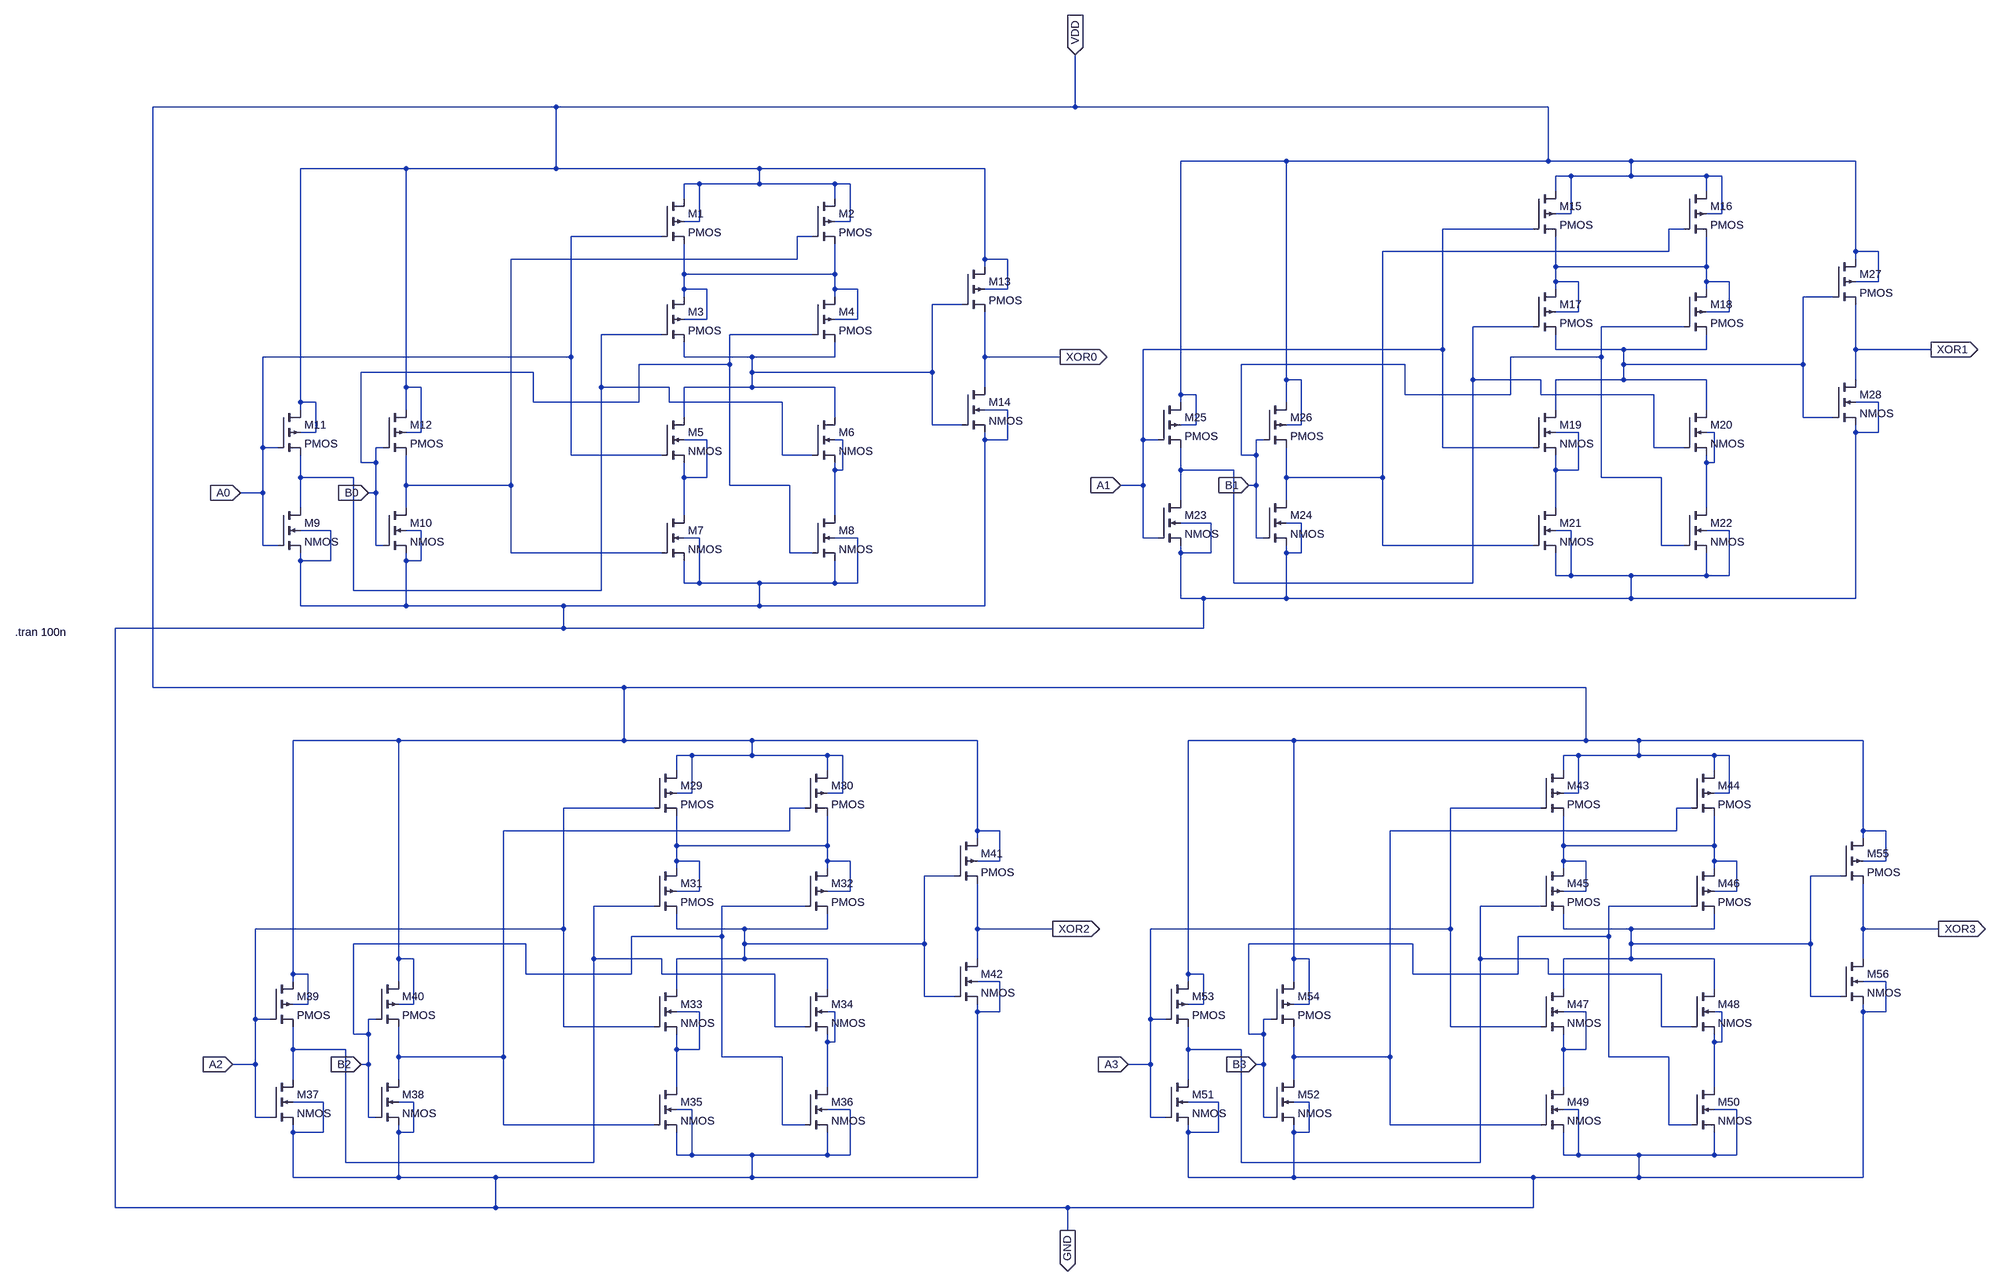
[diagram p0: schematic 4bit_Xor.asc]
4bit_Xor.asc, the LTspice schematic file:
Version 4.1
SHEET 1 3100 2284
WIRE -320 -416 -1424 -416
WIRE 832 -416 832 -624
WIRE 832 -416 -320 -416
WIRE 2096 -416 832 -416
WIRE 1280 -208 1056 -208
WIRE 2096 -208 2096 -416
WIRE 2096 -208 1280 -208
WIRE 2272 -208 2096 -208
WIRE 2800 -208 2272 -208
WIRE -880 -192 -1104 -192
WIRE -320 -192 -320 -416
WIRE -320 -192 -880 -192
WIRE 112 -192 -320 -192
WIRE 640 -192 112 -192
WIRE 2144 -176 2112 -176
WIRE 2272 -176 2272 -208
WIRE 2272 -176 2144 -176
WIRE 2432 -176 2272 -176
WIRE 2464 -176 2432 -176
WIRE -16 -160 -48 -160
WIRE 112 -160 112 -192
WIRE 112 -160 -16 -160
WIRE 272 -160 112 -160
WIRE 304 -160 272 -160
WIRE 2112 -144 2112 -176
WIRE 2432 -144 2432 -176
WIRE -48 -128 -48 -160
WIRE 272 -128 272 -160
WIRE 2144 -96 2144 -176
WIRE 2144 -96 2112 -96
WIRE 2464 -96 2464 -176
WIRE 2464 -96 2432 -96
WIRE -16 -80 -16 -160
WIRE -16 -80 -48 -80
WIRE 304 -80 304 -160
WIRE 304 -80 272 -80
WIRE 2064 -64 1872 -64
WIRE 2384 -64 2352 -64
WIRE -96 -48 -288 -48
WIRE 224 -48 192 -48
WIRE 2352 -16 2352 -64
WIRE 2352 -16 1744 -16
WIRE 2800 -16 2800 -208
WIRE 2848 -16 2800 -16
WIRE 192 0 192 -48
WIRE 192 0 -416 0
WIRE 640 0 640 -192
WIRE 688 0 640 0
WIRE 2800 0 2800 -16
WIRE 640 16 640 0
WIRE 2112 16 2112 -48
WIRE 2432 16 2432 -48
WIRE 2432 16 2112 16
WIRE -48 32 -48 -32
WIRE 272 32 272 -32
WIRE 272 32 -48 32
WIRE 2112 48 2112 16
WIRE 2160 48 2112 48
WIRE 2432 48 2432 16
WIRE 2480 48 2432 48
WIRE 2848 48 2848 -16
WIRE 2848 48 2800 48
WIRE -48 64 -48 32
WIRE 0 64 -48 64
WIRE 272 64 272 32
WIRE 320 64 272 64
WIRE 688 64 688 0
WIRE 688 64 640 64
WIRE 2112 64 2112 48
WIRE 2432 64 2432 48
WIRE -48 80 -48 64
WIRE 272 80 272 64
WIRE 2752 80 2688 80
WIRE 592 96 528 96
WIRE 2160 112 2160 48
WIRE 2160 112 2112 112
WIRE 2480 112 2480 48
WIRE 2480 112 2432 112
WIRE 0 128 0 64
WIRE 0 128 -48 128
WIRE 320 128 320 64
WIRE 320 128 272 128
WIRE 2064 144 1936 144
WIRE 2384 144 2208 144
WIRE -96 160 -224 160
WIRE 224 160 48 160
WIRE 1872 192 1872 -64
WIRE 1872 192 976 192
WIRE 2112 192 2112 160
WIRE 2256 192 2112 192
WIRE 2432 192 2432 160
WIRE 2432 192 2256 192
WIRE 2800 192 2800 96
WIRE 2960 192 2800 192
WIRE -288 208 -288 -48
WIRE -288 208 -1184 208
WIRE -48 208 -48 176
WIRE 96 208 -48 208
WIRE 272 208 272 176
WIRE 272 208 96 208
WIRE 640 208 640 112
WIRE 800 208 640 208
WIRE 2208 208 2208 144
WIRE 2208 208 2016 208
WIRE 48 224 48 160
WIRE 48 224 -144 224
WIRE 1792 224 1184 224
WIRE 2256 224 2256 192
WIRE 2688 224 2688 80
WIRE 2688 224 2256 224
WIRE -368 240 -976 240
WIRE 96 240 96 208
WIRE 528 240 528 96
WIRE 528 240 96 240
WIRE 1280 256 1280 -208
WIRE 1312 256 1280 256
WIRE 1936 256 1936 144
WIRE 2080 256 1936 256
WIRE 2256 256 2256 224
WIRE 2256 256 2112 256
WIRE 2432 256 2256 256
WIRE 2800 256 2800 192
WIRE -880 272 -880 -192
WIRE -848 272 -880 272
WIRE -224 272 -224 160
WIRE -80 272 -224 272
WIRE 96 272 96 240
WIRE 96 272 -48 272
WIRE 272 272 96 272
WIRE 640 272 640 208
WIRE 1056 288 1056 -208
WIRE 1088 288 1056 288
WIRE 1792 288 1792 224
WIRE 2016 288 2016 208
WIRE 2016 288 1792 288
WIRE 2080 288 2080 256
WIRE 2320 288 2080 288
WIRE -1104 304 -1104 -192
WIRE -1072 304 -1104 304
WIRE -368 304 -368 240
WIRE -144 304 -144 224
WIRE -144 304 -368 304
WIRE -80 304 -80 272
WIRE 160 304 -80 304
WIRE 1056 304 1056 288
WIRE 1280 304 1280 256
WIRE 2848 304 2800 304
WIRE -1104 320 -1104 304
WIRE -880 320 -880 272
WIRE 688 320 640 320
WIRE 2112 320 2112 256
WIRE 2432 320 2432 256
WIRE -48 336 -48 272
WIRE 272 336 272 272
WIRE 2688 336 2688 224
WIRE 2752 336 2688 336
WIRE 528 352 528 240
WIRE 592 352 528 352
WIRE 1088 352 1088 288
WIRE 1088 352 1056 352
WIRE 1312 352 1312 256
WIRE 1312 352 1280 352
WIRE -1072 368 -1072 304
WIRE -1072 368 -1104 368
WIRE -848 368 -848 272
WIRE -848 368 -880 368
WIRE 2160 368 2112 368
WIRE 2448 368 2432 368
WIRE 2800 368 2800 352
WIRE 2848 368 2848 304
WIRE 2848 368 2800 368
WIRE 0 384 -48 384
WIRE 288 384 272 384
WIRE 640 384 640 368
WIRE 688 384 688 320
WIRE 688 384 640 384
WIRE 976 384 976 192
WIRE 1008 384 976 384
WIRE 1232 384 1216 384
WIRE -1184 400 -1184 208
WIRE -1152 400 -1184 400
WIRE -928 400 -944 400
WIRE 1872 400 1872 192
WIRE 2064 400 1872 400
WIRE 2320 400 2320 288
WIRE 2384 400 2320 400
WIRE -288 416 -288 208
WIRE -96 416 -288 416
WIRE 160 416 160 304
WIRE 224 416 160 416
WIRE 1184 416 1184 224
WIRE 1216 416 1216 384
WIRE 1216 416 1184 416
WIRE -976 432 -976 240
WIRE -944 432 -944 400
WIRE -944 432 -976 432
WIRE 2432 432 2432 416
WIRE 2448 432 2448 368
WIRE 2448 432 2432 432
WIRE 272 448 272 432
WIRE 288 448 288 384
WIRE 288 448 272 448
WIRE 1056 448 1056 400
WIRE 1168 448 1056 448
WIRE 2112 448 2112 416
WIRE 2160 448 2160 368
WIRE 2160 448 2112 448
WIRE -1104 464 -1104 416
WIRE -992 464 -1104 464
WIRE -48 464 -48 432
WIRE 0 464 0 384
WIRE 0 464 -48 464
WIRE 1280 464 1280 400
WIRE 1744 464 1744 -16
WIRE 1744 464 1280 464
WIRE 2208 464 2208 208
WIRE 2336 464 2208 464
WIRE -880 480 -880 416
WIRE -416 480 -416 0
WIRE -416 480 -880 480
WIRE 48 480 48 224
WIRE 176 480 48 480
WIRE 976 480 976 384
WIRE 976 480 928 480
WIRE 1216 480 1216 416
WIRE 1216 480 1200 480
WIRE -1184 496 -1184 400
WIRE -1184 496 -1232 496
WIRE -944 496 -944 432
WIRE -944 496 -960 496
WIRE 1056 512 1056 448
WIRE 1280 512 1280 464
WIRE -1104 528 -1104 464
WIRE -880 528 -880 480
WIRE 2112 528 2112 448
WIRE 2432 528 2432 432
WIRE -48 544 -48 464
WIRE 272 544 272 448
WIRE 1120 560 1056 560
WIRE 1312 560 1280 560
WIRE -1040 576 -1104 576
WIRE -848 576 -880 576
WIRE 2144 576 2112 576
WIRE 2480 576 2432 576
WIRE -16 592 -48 592
WIRE 320 592 272 592
WIRE 976 592 976 480
WIRE 1008 592 976 592
WIRE 1216 592 1216 480
WIRE 1232 592 1216 592
WIRE -1184 608 -1184 496
WIRE -1152 608 -1184 608
WIRE -944 608 -944 496
WIRE -928 608 -944 608
WIRE 1744 608 1744 464
WIRE 2064 608 1744 608
WIRE 2336 608 2336 464
WIRE 2384 608 2336 608
WIRE -416 624 -416 480
WIRE -96 624 -416 624
WIRE 176 624 176 480
WIRE 224 624 176 624
WIRE 1056 624 1056 608
WIRE 1120 624 1120 560
WIRE 1120 624 1056 624
WIRE 1280 624 1280 608
WIRE 1312 624 1312 560
WIRE 1312 624 1280 624
WIRE -1104 640 -1104 624
WIRE -1040 640 -1040 576
WIRE -1040 640 -1104 640
WIRE -880 640 -880 624
WIRE -848 640 -848 576
WIRE -848 640 -880 640
WIRE 2112 672 2112 624
WIRE 2144 672 2144 576
WIRE 2144 672 2112 672
WIRE 2272 672 2144 672
WIRE 2432 672 2432 624
WIRE 2432 672 2272 672
WIRE 2480 672 2480 576
WIRE 2480 672 2432 672
WIRE -48 688 -48 640
WIRE -16 688 -16 592
WIRE -16 688 -48 688
WIRE 112 688 -16 688
WIRE 272 688 272 640
WIRE 272 688 112 688
WIRE 320 688 320 592
WIRE 320 688 272 688
WIRE 1168 688 1168 448
WIRE 1936 688 1936 256
WIRE 1936 688 1168 688
WIRE -992 704 -992 464
WIRE -224 704 -224 272
WIRE -224 704 -992 704
WIRE 1056 720 1056 624
WIRE 1104 720 1056 720
WIRE 1280 720 1280 624
WIRE 1280 720 1104 720
WIRE 2272 720 2272 672
WIRE 2272 720 1280 720
WIRE 2800 720 2800 368
WIRE 2800 720 2272 720
WIRE -1104 736 -1104 640
WIRE -880 736 -880 640
WIRE -880 736 -1104 736
WIRE -304 736 -880 736
WIRE 112 736 112 688
WIRE 112 736 -304 736
WIRE 640 736 640 384
WIRE 640 736 112 736
WIRE -304 784 -304 736
WIRE -304 784 -1504 784
WIRE 1104 784 1104 720
WIRE 1104 784 -304 784
WIRE -1424 928 -1424 -416
WIRE -176 928 -1424 928
WIRE 2176 928 -176 928
WIRE -896 1040 -1120 1040
WIRE -176 1040 -176 928
WIRE -176 1040 -896 1040
WIRE 96 1040 -176 1040
WIRE 624 1040 96 1040
WIRE 1296 1040 1072 1040
WIRE 2176 1040 2176 928
WIRE 2176 1040 1296 1040
WIRE 2288 1040 2176 1040
WIRE 2816 1040 2288 1040
WIRE -32 1072 -64 1072
WIRE 96 1072 96 1040
WIRE 96 1072 -32 1072
WIRE 256 1072 96 1072
WIRE 288 1072 256 1072
WIRE 2160 1072 2128 1072
WIRE 2288 1072 2288 1040
WIRE 2288 1072 2160 1072
WIRE 2448 1072 2288 1072
WIRE 2480 1072 2448 1072
WIRE -64 1104 -64 1072
WIRE 256 1104 256 1072
WIRE 2128 1104 2128 1072
WIRE 2448 1104 2448 1072
WIRE -32 1152 -32 1072
WIRE -32 1152 -64 1152
WIRE 288 1152 288 1072
WIRE 288 1152 256 1152
WIRE 2160 1152 2160 1072
WIRE 2160 1152 2128 1152
WIRE 2480 1152 2480 1072
WIRE 2480 1152 2448 1152
WIRE -112 1184 -304 1184
WIRE 208 1184 176 1184
WIRE 2080 1184 1888 1184
WIRE 2400 1184 2368 1184
WIRE 176 1232 176 1184
WIRE 176 1232 -432 1232
WIRE 624 1232 624 1040
WIRE 672 1232 624 1232
WIRE 2368 1232 2368 1184
WIRE 2368 1232 1760 1232
WIRE 2816 1232 2816 1040
WIRE 2864 1232 2816 1232
WIRE 624 1248 624 1232
WIRE 2816 1248 2816 1232
WIRE -64 1264 -64 1200
WIRE 256 1264 256 1200
WIRE 256 1264 -64 1264
WIRE 2128 1264 2128 1200
WIRE 2448 1264 2448 1200
WIRE 2448 1264 2128 1264
WIRE -64 1296 -64 1264
WIRE -16 1296 -64 1296
WIRE 256 1296 256 1264
WIRE 304 1296 256 1296
WIRE 672 1296 672 1232
WIRE 672 1296 624 1296
WIRE 2128 1296 2128 1264
WIRE 2176 1296 2128 1296
WIRE 2448 1296 2448 1264
WIRE 2496 1296 2448 1296
WIRE 2864 1296 2864 1232
WIRE 2864 1296 2816 1296
WIRE -64 1312 -64 1296
WIRE 256 1312 256 1296
WIRE 2128 1312 2128 1296
WIRE 2448 1312 2448 1296
WIRE 576 1328 512 1328
WIRE 2768 1328 2704 1328
WIRE -16 1360 -16 1296
WIRE -16 1360 -64 1360
WIRE 304 1360 304 1296
WIRE 304 1360 256 1360
WIRE 2176 1360 2176 1296
WIRE 2176 1360 2128 1360
WIRE 2496 1360 2496 1296
WIRE 2496 1360 2448 1360
WIRE -112 1392 -240 1392
WIRE 208 1392 32 1392
WIRE 2080 1392 1952 1392
WIRE 2400 1392 2224 1392
WIRE -304 1440 -304 1184
WIRE -304 1440 -1200 1440
WIRE -64 1440 -64 1408
WIRE 80 1440 -64 1440
WIRE 256 1440 256 1408
WIRE 256 1440 80 1440
WIRE 624 1440 624 1344
WIRE 784 1440 624 1440
WIRE 1888 1440 1888 1184
WIRE 1888 1440 992 1440
WIRE 2128 1440 2128 1408
WIRE 2272 1440 2128 1440
WIRE 2448 1440 2448 1408
WIRE 2448 1440 2272 1440
WIRE 2816 1440 2816 1344
WIRE 2976 1440 2816 1440
WIRE 32 1456 32 1392
WIRE 32 1456 -160 1456
WIRE 2224 1456 2224 1392
WIRE 2224 1456 2032 1456
WIRE -384 1472 -992 1472
WIRE 80 1472 80 1440
WIRE 512 1472 512 1328
WIRE 512 1472 80 1472
WIRE 1808 1472 1200 1472
WIRE 2272 1472 2272 1440
WIRE 2704 1472 2704 1328
WIRE 2704 1472 2272 1472
WIRE -896 1504 -896 1040
WIRE -864 1504 -896 1504
WIRE -240 1504 -240 1392
WIRE -96 1504 -240 1504
WIRE 80 1504 80 1472
WIRE 80 1504 -64 1504
WIRE 256 1504 80 1504
WIRE 624 1504 624 1440
WIRE 1296 1504 1296 1040
WIRE 1328 1504 1296 1504
WIRE 1952 1504 1952 1392
WIRE 2096 1504 1952 1504
WIRE 2272 1504 2272 1472
WIRE 2272 1504 2128 1504
WIRE 2448 1504 2272 1504
WIRE 2816 1504 2816 1440
WIRE -1120 1536 -1120 1040
WIRE -1088 1536 -1120 1536
WIRE -384 1536 -384 1472
WIRE -160 1536 -160 1456
WIRE -160 1536 -384 1536
WIRE -96 1536 -96 1504
WIRE 144 1536 -96 1536
WIRE 1072 1536 1072 1040
WIRE 1104 1536 1072 1536
WIRE 1808 1536 1808 1472
WIRE 2032 1536 2032 1456
WIRE 2032 1536 1808 1536
WIRE 2096 1536 2096 1504
WIRE 2336 1536 2096 1536
WIRE -1120 1552 -1120 1536
WIRE -896 1552 -896 1504
WIRE 672 1552 624 1552
WIRE 1072 1552 1072 1536
WIRE 1296 1552 1296 1504
WIRE 2864 1552 2816 1552
WIRE -64 1568 -64 1504
WIRE 256 1568 256 1504
WIRE 2128 1568 2128 1504
WIRE 2448 1568 2448 1504
WIRE 512 1584 512 1472
WIRE 576 1584 512 1584
WIRE 2704 1584 2704 1472
WIRE 2768 1584 2704 1584
WIRE -1088 1600 -1088 1536
WIRE -1088 1600 -1120 1600
WIRE -864 1600 -864 1504
WIRE -864 1600 -896 1600
WIRE 1104 1600 1104 1536
WIRE 1104 1600 1072 1600
WIRE 1328 1600 1328 1504
WIRE 1328 1600 1296 1600
WIRE -16 1616 -64 1616
WIRE 272 1616 256 1616
WIRE 624 1616 624 1600
WIRE 672 1616 672 1552
WIRE 672 1616 624 1616
WIRE 2176 1616 2128 1616
WIRE 2464 1616 2448 1616
WIRE 2816 1616 2816 1600
WIRE 2864 1616 2864 1552
WIRE 2864 1616 2816 1616
WIRE -1200 1632 -1200 1440
WIRE -1168 1632 -1200 1632
WIRE -944 1632 -960 1632
WIRE 992 1632 992 1440
WIRE 1024 1632 992 1632
WIRE 1248 1632 1232 1632
WIRE -304 1648 -304 1440
WIRE -112 1648 -304 1648
WIRE 144 1648 144 1536
WIRE 208 1648 144 1648
WIRE 1888 1648 1888 1440
WIRE 2080 1648 1888 1648
WIRE 2336 1648 2336 1536
WIRE 2400 1648 2336 1648
WIRE -992 1664 -992 1472
WIRE -960 1664 -960 1632
WIRE -960 1664 -992 1664
WIRE 1200 1664 1200 1472
WIRE 1232 1664 1232 1632
WIRE 1232 1664 1200 1664
WIRE 256 1680 256 1664
WIRE 272 1680 272 1616
WIRE 272 1680 256 1680
WIRE 2448 1680 2448 1664
WIRE 2464 1680 2464 1616
WIRE 2464 1680 2448 1680
WIRE -1120 1696 -1120 1648
WIRE -1008 1696 -1120 1696
WIRE -64 1696 -64 1664
WIRE -16 1696 -16 1616
WIRE -16 1696 -64 1696
WIRE 1072 1696 1072 1648
WIRE 1184 1696 1072 1696
WIRE 2128 1696 2128 1664
WIRE 2176 1696 2176 1616
WIRE 2176 1696 2128 1696
WIRE -896 1712 -896 1648
WIRE -432 1712 -432 1232
WIRE -432 1712 -896 1712
WIRE 32 1712 32 1456
WIRE 160 1712 32 1712
WIRE 1296 1712 1296 1648
WIRE 1760 1712 1760 1232
WIRE 1760 1712 1296 1712
WIRE 2224 1712 2224 1456
WIRE 2352 1712 2224 1712
WIRE -1200 1728 -1200 1632
WIRE -1200 1728 -1248 1728
WIRE -960 1728 -960 1664
WIRE -960 1728 -976 1728
WIRE 992 1728 992 1632
WIRE 992 1728 944 1728
WIRE 1232 1728 1232 1664
WIRE 1232 1728 1216 1728
WIRE -1120 1760 -1120 1696
WIRE -896 1760 -896 1712
WIRE 1072 1760 1072 1696
WIRE 1296 1760 1296 1712
WIRE -64 1776 -64 1696
WIRE 256 1776 256 1680
WIRE 2128 1776 2128 1696
WIRE 2448 1776 2448 1680
WIRE -1056 1808 -1120 1808
WIRE -864 1808 -896 1808
WIRE 1136 1808 1072 1808
WIRE 1328 1808 1296 1808
WIRE -32 1824 -64 1824
WIRE 304 1824 256 1824
WIRE 2160 1824 2128 1824
WIRE 2496 1824 2448 1824
WIRE -1200 1840 -1200 1728
WIRE -1168 1840 -1200 1840
WIRE -960 1840 -960 1728
WIRE -944 1840 -960 1840
WIRE 992 1840 992 1728
WIRE 1024 1840 992 1840
WIRE 1232 1840 1232 1728
WIRE 1248 1840 1232 1840
WIRE -432 1856 -432 1712
WIRE -112 1856 -432 1856
WIRE 160 1856 160 1712
WIRE 208 1856 160 1856
WIRE 1760 1856 1760 1712
WIRE 2080 1856 1760 1856
WIRE 2352 1856 2352 1712
WIRE 2400 1856 2352 1856
WIRE -1120 1872 -1120 1856
WIRE -1056 1872 -1056 1808
WIRE -1056 1872 -1120 1872
WIRE -896 1872 -896 1856
WIRE -864 1872 -864 1808
WIRE -864 1872 -896 1872
WIRE 1072 1872 1072 1856
WIRE 1136 1872 1136 1808
WIRE 1136 1872 1072 1872
WIRE 1296 1872 1296 1856
WIRE 1328 1872 1328 1808
WIRE 1328 1872 1296 1872
WIRE -64 1920 -64 1872
WIRE -32 1920 -32 1824
WIRE -32 1920 -64 1920
WIRE 96 1920 -32 1920
WIRE 256 1920 256 1872
WIRE 256 1920 96 1920
WIRE 304 1920 304 1824
WIRE 304 1920 256 1920
WIRE 2128 1920 2128 1872
WIRE 2160 1920 2160 1824
WIRE 2160 1920 2128 1920
WIRE 2288 1920 2160 1920
WIRE 2448 1920 2448 1872
WIRE 2448 1920 2288 1920
WIRE 2496 1920 2496 1824
WIRE 2496 1920 2448 1920
WIRE -1008 1936 -1008 1696
WIRE -240 1936 -240 1504
WIRE -240 1936 -1008 1936
WIRE 1184 1936 1184 1696
WIRE 1952 1936 1952 1504
WIRE 1952 1936 1184 1936
WIRE -1120 1968 -1120 1872
WIRE -896 1968 -896 1872
WIRE -896 1968 -1120 1968
WIRE -448 1968 -896 1968
WIRE 96 1968 96 1920
WIRE 96 1968 -448 1968
WIRE 624 1968 624 1616
WIRE 624 1968 96 1968
WIRE 1072 1968 1072 1872
WIRE 1296 1968 1296 1872
WIRE 1296 1968 1072 1968
WIRE 2064 1968 1296 1968
WIRE 2288 1968 2288 1920
WIRE 2288 1968 2064 1968
WIRE 2816 1968 2816 1616
WIRE 2816 1968 2288 1968
WIRE -1504 2032 -1504 784
WIRE -448 2032 -448 1968
WIRE -448 2032 -1504 2032
WIRE 816 2032 -448 2032
WIRE 2064 2032 2064 1968
WIRE 2064 2032 816 2032
WIRE 816 2080 816 2032
FLAG -960 496 B0
IOPIN -960 496 In
FLAG 832 -624 VDD
IOPIN 832 -624 In
FLAG 800 208 XOR0
IOPIN 800 208 Out
FLAG -1232 496 A0
IOPIN -1232 496 In
FLAG 1200 480 B1
IOPIN 1200 480 In
FLAG 2960 192 XOR1
IOPIN 2960 192 Out
FLAG 928 480 A1
IOPIN 928 480 In
FLAG -976 1728 B2
IOPIN -976 1728 In
FLAG 784 1440 XOR2
IOPIN 784 1440 Out
FLAG -1248 1728 A2
IOPIN -1248 1728 In
FLAG 1216 1728 B3
IOPIN 1216 1728 In
FLAG 2976 1440 XOR3
IOPIN 2976 1440 Out
FLAG 944 1728 A3
IOPIN 944 1728 In
FLAG 816 2080 GND
IOPIN 816 2080 Out
SYMBOL pmos4 -96 -128 R0
SYMATTR InstName M1
SYMBOL pmos4 224 -128 R0
SYMATTR InstName M2
SYMBOL pmos4 -96 80 R0
SYMATTR InstName M3
SYMBOL pmos4 224 80 R0
SYMATTR InstName M4
SYMBOL nmos4 -96 336 R0
SYMATTR InstName M5
SYMBOL nmos4 224 336 R0
SYMATTR InstName M6
SYMBOL nmos4 -96 544 R0
SYMATTR InstName M7
SYMBOL nmos4 224 544 R0
SYMATTR InstName M8
SYMBOL nmos4 -1152 528 R0
SYMATTR InstName M9
SYMBOL nmos4 -928 528 R0
SYMATTR InstName M10
SYMBOL pmos4 -1152 320 R0
SYMATTR InstName M11
SYMBOL pmos4 -928 320 R0
SYMATTR InstName M12
SYMBOL pmos4 592 16 R0
SYMATTR InstName M13
SYMBOL nmos4 592 272 R0
SYMATTR InstName M14
SYMBOL pmos4 2064 -144 R0
SYMATTR InstName M15
SYMBOL pmos4 2384 -144 R0
SYMATTR InstName M16
SYMBOL pmos4 2064 64 R0
SYMATTR InstName M17
SYMBOL pmos4 2384 64 R0
SYMATTR InstName M18
SYMBOL nmos4 2064 320 R0
SYMATTR InstName M19
SYMBOL nmos4 2384 320 R0
SYMATTR InstName M20
SYMBOL nmos4 2064 528 R0
SYMATTR InstName M21
SYMBOL nmos4 2384 528 R0
SYMATTR InstName M22
SYMBOL nmos4 1008 512 R0
SYMATTR InstName M23
SYMBOL nmos4 1232 512 R0
SYMATTR InstName M24
SYMBOL pmos4 1008 304 R0
SYMATTR InstName M25
SYMBOL pmos4 1232 304 R0
SYMATTR InstName M26
SYMBOL pmos4 2752 0 R0
SYMATTR InstName M27
SYMBOL nmos4 2752 256 R0
SYMATTR InstName M28
SYMBOL pmos4 -112 1104 R0
SYMATTR InstName M29
SYMBOL pmos4 208 1104 R0
SYMATTR InstName M30
SYMBOL pmos4 -112 1312 R0
SYMATTR InstName M31
SYMBOL pmos4 208 1312 R0
SYMATTR InstName M32
SYMBOL nmos4 -112 1568 R0
SYMATTR InstName M33
SYMBOL nmos4 208 1568 R0
SYMATTR InstName M34
SYMBOL nmos4 -112 1776 R0
SYMATTR InstName M35
SYMBOL nmos4 208 1776 R0
SYMATTR InstName M36
SYMBOL nmos4 -1168 1760 R0
SYMATTR InstName M37
SYMBOL nmos4 -944 1760 R0
SYMATTR InstName M38
SYMBOL pmos4 -1168 1552 R0
SYMATTR InstName M39
SYMBOL pmos4 -944 1552 R0
SYMATTR InstName M40
SYMBOL pmos4 576 1248 R0
SYMATTR InstName M41
SYMBOL nmos4 576 1504 R0
SYMATTR InstName M42
SYMBOL pmos4 2080 1104 R0
SYMATTR InstName M43
SYMBOL pmos4 2400 1104 R0
SYMATTR InstName M44
SYMBOL pmos4 2080 1312 R0
SYMATTR InstName M45
SYMBOL pmos4 2400 1312 R0
SYMATTR InstName M46
SYMBOL nmos4 2080 1568 R0
SYMATTR InstName M47
SYMBOL nmos4 2400 1568 R0
SYMATTR InstName M48
SYMBOL nmos4 2080 1776 R0
SYMATTR InstName M49
SYMBOL nmos4 2400 1776 R0
SYMATTR InstName M50
SYMBOL nmos4 1024 1760 R0
SYMATTR InstName M51
SYMBOL nmos4 1248 1760 R0
SYMATTR InstName M52
SYMBOL pmos4 1024 1552 R0
SYMATTR InstName M53
SYMBOL pmos4 1248 1552 R0
SYMATTR InstName M54
SYMBOL pmos4 2768 1248 R0
SYMATTR InstName M55
SYMBOL nmos4 2768 1504 R0
SYMATTR InstName M56
TEXT -2240 792 Left 2 !.tran 100n

The netlist it stands for:
* 4bit_Xor.asc
M1 VDD A0 N004 VDD PMOS
M2 VDD N002 N004 VDD PMOS
M3 N004 N008 N006 N004 PMOS
M4 N004 B0 N006 N004 PMOS
M5 N006 A0 N011 N011 NMOS
M6 N006 N008 N012 N012 NMOS
M7 N011 N002 GND GND NMOS
M8 N012 B0 GND GND NMOS
M9 N008 A0 GND GND NMOS
M10 N002 B0 GND GND NMOS
M11 VDD A0 N008 VDD PMOS
M12 VDD B0 N002 VDD PMOS
M13 VDD N006 XOR0 VDD PMOS
M14 XOR0 N006 GND GND NMOS
M15 VDD A1 N003 VDD PMOS
M16 VDD N001 N003 VDD PMOS
M17 N003 N007 N005 N003 PMOS
M18 N003 B1 N005 N003 PMOS
M19 N005 A1 N009 N009 NMOS
M20 N005 N007 N010 N010 NMOS
M21 N009 N001 GND GND NMOS
M22 N010 B1 GND GND NMOS
M23 N007 A1 GND GND NMOS
M24 N001 B1 GND GND NMOS
M25 VDD A1 N007 VDD PMOS
M26 VDD B1 N001 VDD PMOS
M27 VDD N005 XOR1 VDD PMOS
M28 XOR1 N005 GND GND NMOS
M29 VDD A2 N015 VDD PMOS
M30 VDD N013 N015 VDD PMOS
M31 N015 N019 N017 N015 PMOS
M32 N015 B2 N017 N015 PMOS
M33 N017 A2 N021 N021 NMOS
M34 N017 N019 N022 N022 NMOS
M35 N021 N013 GND GND NMOS
M36 N022 B2 GND GND NMOS
M37 N019 A2 GND GND NMOS
M38 N013 B2 GND GND NMOS
M39 VDD A2 N019 VDD PMOS
M40 VDD B2 N013 VDD PMOS
M41 VDD N017 XOR2 VDD PMOS
M42 XOR2 N017 GND GND NMOS
M43 VDD A3 N016 VDD PMOS
M44 VDD N014 N016 VDD PMOS
M45 N016 N020 N018 N016 PMOS
M46 N016 B3 N018 N016 PMOS
M47 N018 A3 N023 N023 NMOS
M48 N018 N020 N024 N024 NMOS
M49 N023 N014 GND GND NMOS
M50 N024 B3 GND GND NMOS
M51 N020 A3 GND GND NMOS
M52 N014 B3 GND GND NMOS
M53 VDD A3 N020 VDD PMOS
M54 VDD B3 N014 VDD PMOS
M55 VDD N018 XOR3 VDD PMOS
M56 XOR3 N018 GND GND NMOS
.model NMOS NMOS
.model PMOS PMOS
.lib standard.mos
.tran 100n
.backanno
.end